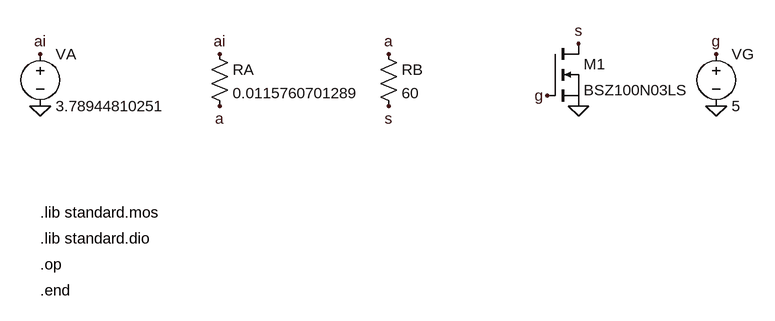
[diagram p0: schematic shunt_real.asc]
shunt_real.asc, the LTspice schematic file:
Version 4
SHEET 1 1880 1200
SYMBOL voltage 160 120 R0
SYMATTR InstName VA
SYMATTR Value 3.78944810251
FLAG 160 136 ai
FLAG 160 216 0
SYMBOL res 420 120 R0
SYMATTR InstName RA
SYMATTR Value 0.0115760701289
FLAG 436 136 ai
FLAG 436 216 a
SYMBOL res 680 120 R0
SYMATTR InstName RB
SYMATTR Value 60
FLAG 696 136 a
FLAG 696 216 s
SYMBOL nmos 940 120 R0
SYMATTR InstName M1
SYMATTR Value BSZ100N03LS
FLAG 988 120 s
FLAG 940 200 g
FLAG 988 216 0
SYMBOL voltage 1200 120 R0
SYMATTR InstName VG
SYMATTR Value 5
FLAG 1200 136 g
FLAG 1200 216 0
TEXT 160 380 Left 2 !.lib standard.mos
TEXT 160 420 Left 2 !.lib standard.dio
TEXT 160 460 Left 2 !.op
TEXT 160 500 Left 2 !.end

The netlist it stands for:
* shunt_real.asc
VA ai 0 3.78944810251
RA ai a 0.0115760701289
RB a s 60
M1 s g 0 0 BSZ100N03LS
VG g 0 5
.model NMOS NMOS
.model PMOS PMOS
.lib standard.mos
.lib standard.mos
.lib standard.dio
.op
.end
.backanno
.end